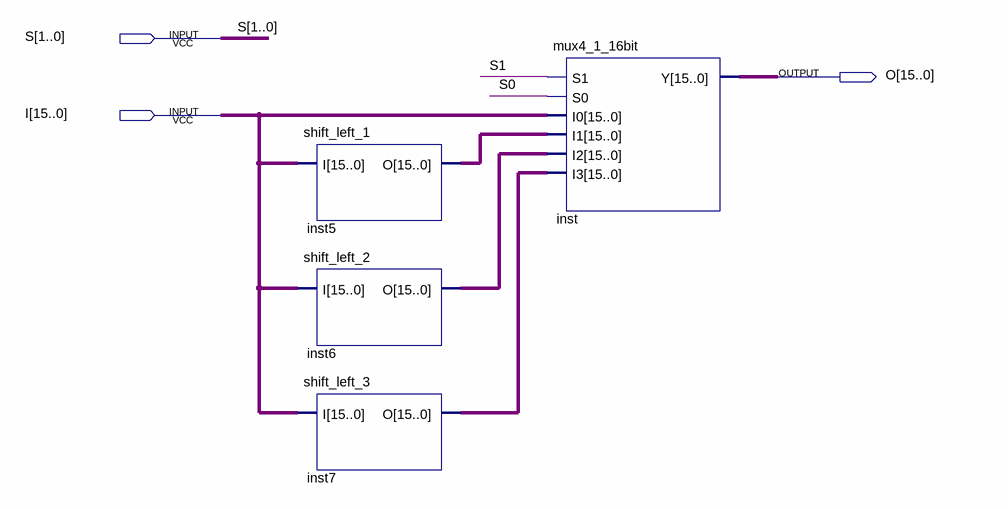
[diagram p0: schematic sheet]
// Quartus schematic shift.bdf as structural Verilog: 4 symbols, 3 pins
module shift (
  input  [1:0] S,
  input  [15:0] I,
  output [15:0] O
);

  wire [15:0] inst5_o, inst6_o, inst7_o;

  shift_left_1 inst5 (.I(I), .O(inst5_o));
  shift_left_2 inst6 (.I(I), .O(inst6_o));
  shift_left_3 inst7 (.I(I), .O(inst7_o));
  mux4_1_16bit inst (.S1(S[1]), .S0(S[0]), .I0(I), .I1(inst5_o), .I2(inst6_o), .I3(inst7_o), .Y(O));
endmodule
